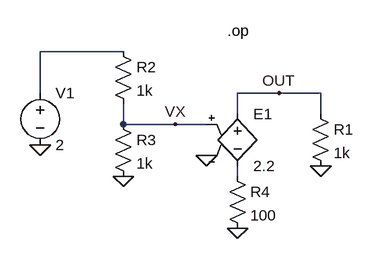
[diagram p0: schematic lt_test_esource.asc]
lt_test_esource.asc, the LTspice schematic file:
Version 4.1
SHEET 1 880 680
WIRE 80 32 -48 32
WIRE -48 96 -48 32
WIRE 320 96 256 96
WIRE 384 96 320 96
WIRE 256 128 256 96
WIRE 384 128 384 96
WIRE 80 144 80 112
WIRE 160 144 80 144
WIRE 208 144 160 144
WIRE 256 224 256 208
FLAG 80 224 0
FLAG 256 304 0
FLAG 384 208 0
FLAG -48 176 0
FLAG 208 192 0
FLAG 320 96 OUT
FLAG 160 144 VX
SYMBOL e 256 112 R0
SYMATTR InstName E1
SYMATTR Value 2.2
SYMBOL res 368 112 R0
SYMATTR InstName R1
SYMATTR Value 1k
SYMBOL res 64 16 R0
SYMATTR InstName R2
SYMATTR Value 1k
SYMBOL res 64 128 R0
SYMATTR InstName R3
SYMATTR Value 1k
SYMBOL res 240 208 R0
SYMATTR InstName R4
SYMATTR Value 100
SYMBOL voltage -48 80 R0
WINDOW 123 0 0 Left 0
WINDOW 39 0 0 Left 0
SYMATTR InstName V1
SYMATTR Value 2
TEXT 240 0 Left 2 !.op

The netlist it stands for:
* lt_test_esource.asc
E1 OUT N002 VX 0 2.2
R1 OUT 0 1k
R2 N001 VX 1k
R3 VX 0 1k
R4 N002 0 100
V1 N001 0 2
.op
.backanno
.end